# Altium schematic sheet PIC18F16Q20_Curiosity_Nano_Target_MCU.SchDoc
size A3; SheetTitle: Target MCU; CompanyName: Microchip Technology Inc.; Organization: Microchip Technology; Address1: 2355 West Chandler Blvd.; Address2: Chandler, AZ  85224; Address4: USA; SheetNumber: 2; SheetTotal: 4; Time: Time
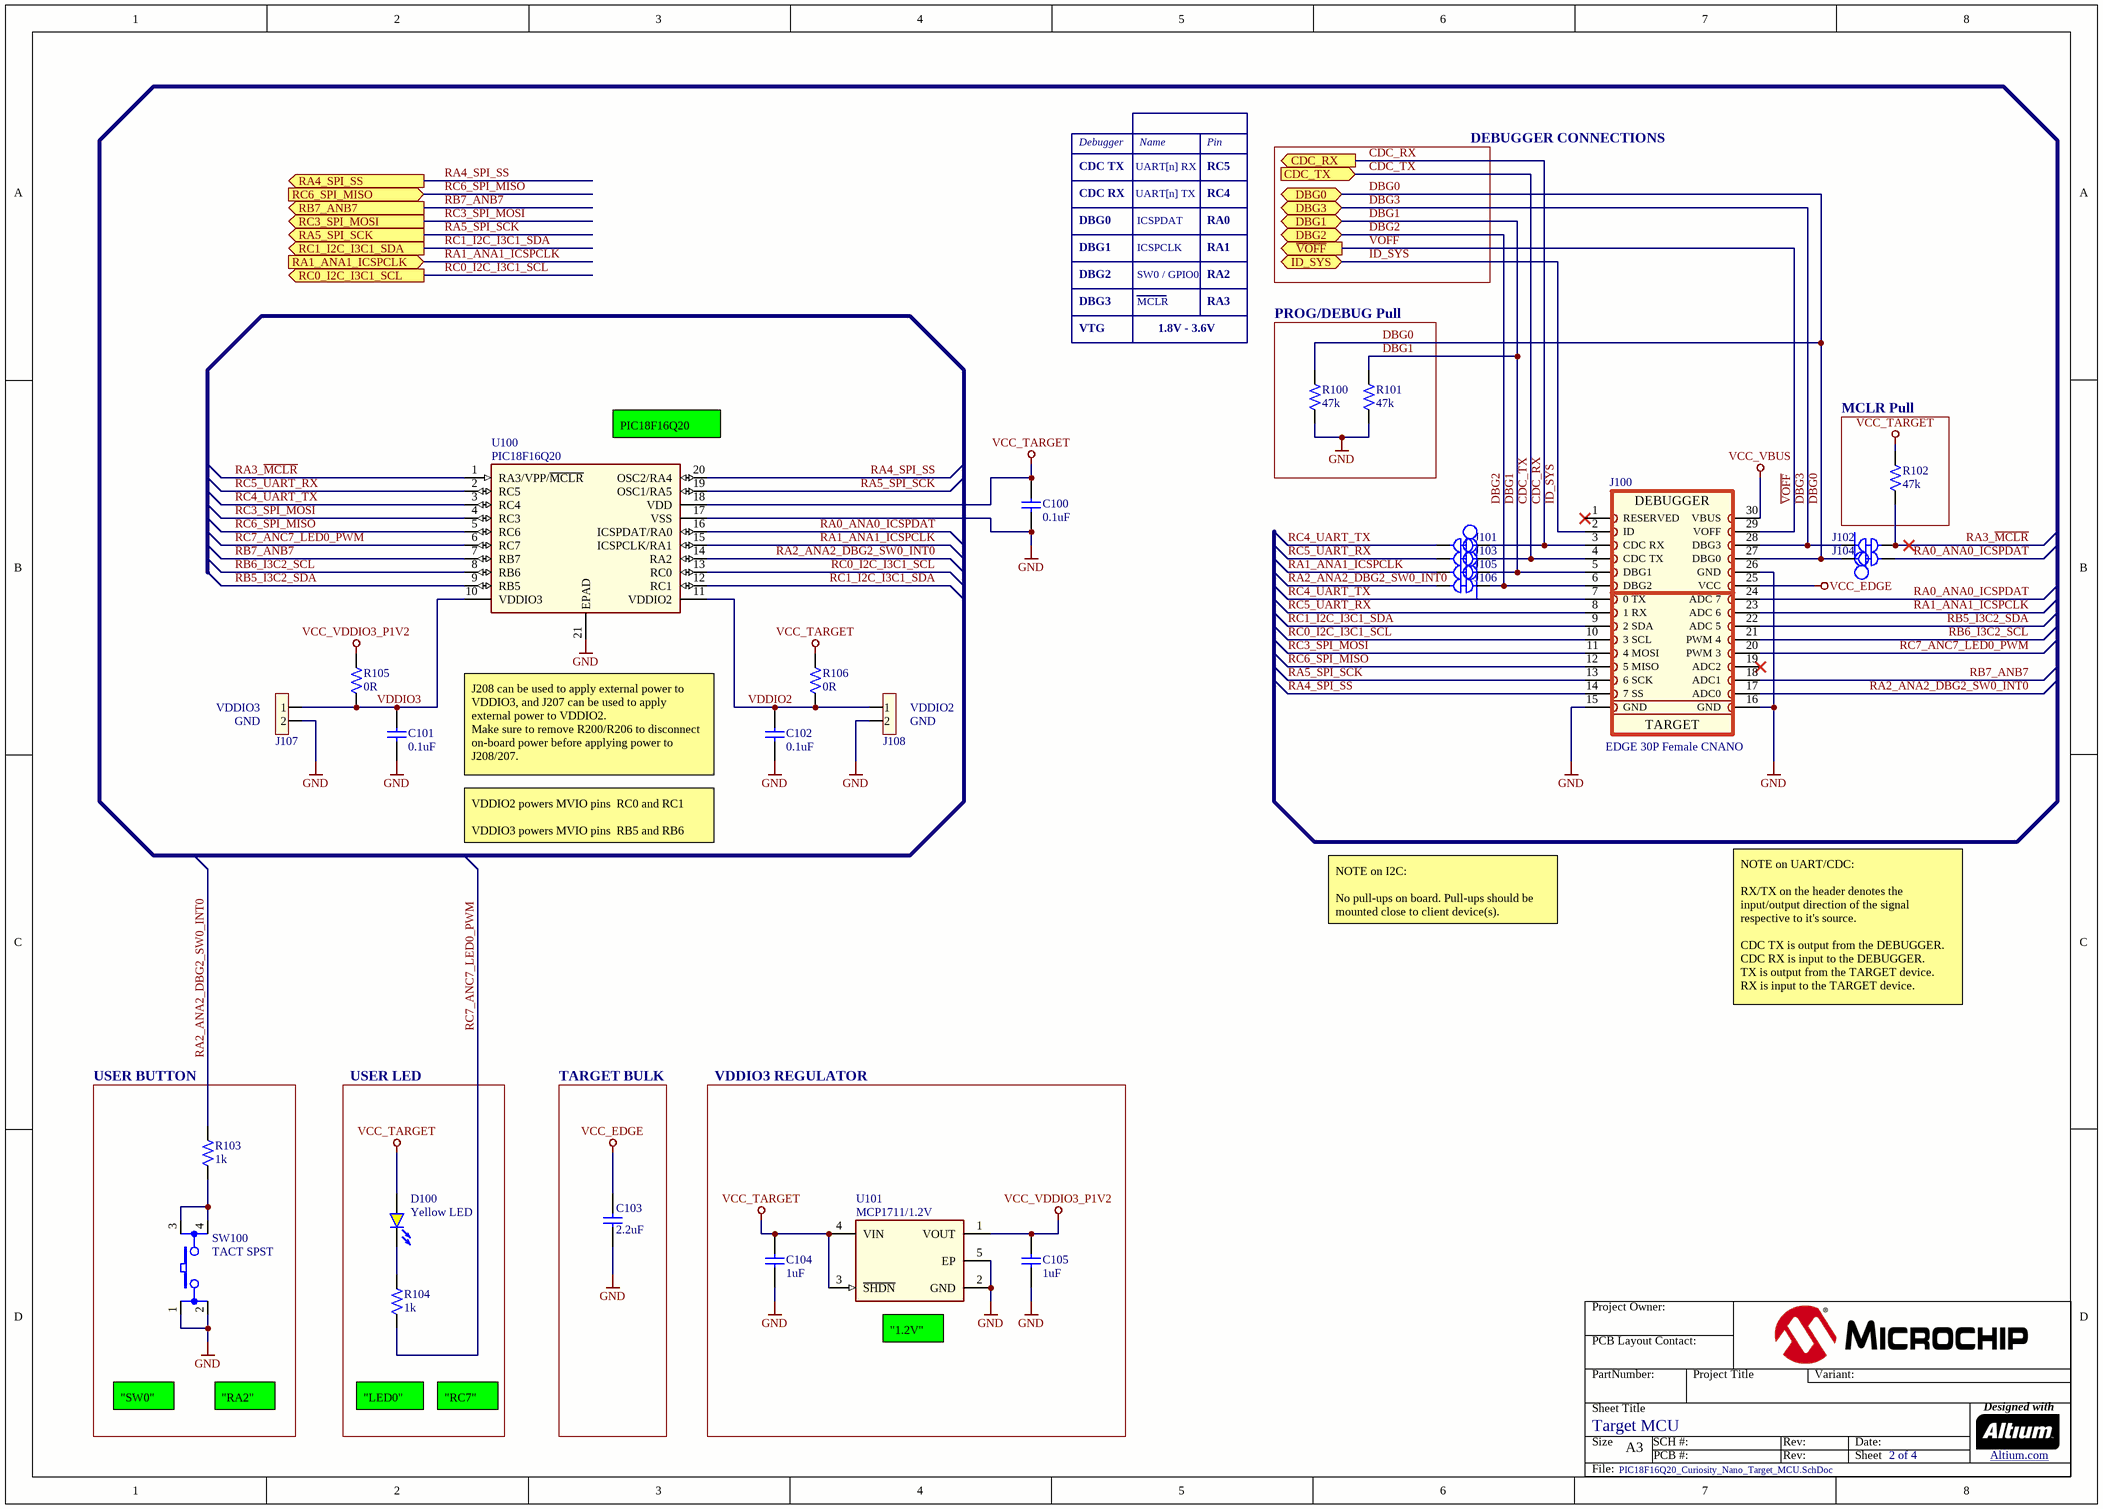
[diagram p0: PIC18F16Q20_Curiosity_Nano_Target_MCU.SchDoc]

## Parts
C100  value 0.1uF  [CAP_C_0402]  (hidden comment: Capacitor NP)
C101  value 0.1uF  [CAP_C_0402]  (hidden comment: Capacitor NP)
C102  value 0.1uF  [CAP_C_0402]  (hidden comment: Capacitor NP)
C103  value 2.2uF  [CAP_C_0402]  (hidden comment: Capacitor NP)
C104  value 1uF  [CAP_C_0402]  (hidden comment: Capacitor NP)
C105  value 1uF  [CAP_C_0402]  (hidden comment: Capacitor NP)
D100  value Yellow LED  [LED_0603_Yellow]  (hidden comment: LED_yellow)
J100  value EDGE 30P Female CNANO  [CON_EDGE_CNANO-30]  (hidden comment: CON EDGE CNANO-30)  (no BOM)
J101  CON JMPR LINK CLOSED  [CON_JMPR_0402_PCB_TRACE_LINK_0.9mm_PAD_0.6mm_PTH]  (value not drawn)  (net tie, no BOM)
J102  CON JMPR LINK CLOSED  [CON_JMPR_0402_PCB_TRACE_LINK_0.9mm_PAD_0.6mm_PTH]  (value not drawn)  (net tie, no BOM)
J103  CON JMPR LINK CLOSED  [CON_JMPR_0402_PCB_TRACE_LINK_0.9mm_PAD_0.6mm_PTH]  (value not drawn)  (net tie, no BOM)
J104  CON JMPR LINK CLOSED  [CON_JMPR_0402_PCB_TRACE_LINK_0.9mm_PAD_0.6mm_PTH]  (value not drawn)  (net tie, no BOM)
J105  CON JMPR LINK CLOSED  [CON_JMPR_0402_PCB_TRACE_LINK_0.9mm_PAD_0.6mm_PTH]  (value not drawn)  (net tie, no BOM)
J106  CON JMPR LINK CLOSED  [CON_JMPR_0402_PCB_TRACE_LINK_0.9mm_PAD_0.6mm_PTH]  (value not drawn)  (net tie, no BOM)
J107  Header 1x2  [HDR_M_2.54_1x2]  (value not drawn)
J108  Header 1x2  [HDR_M_2.54_1x2]  (value not drawn)
R100  value 47k  [RES_C_0402]  (hidden comment: Resistor)
R101  value 47k  [RES_C_0402]  (hidden comment: Resistor)
R102  value 47k  [RES_C_0402]  (hidden comment: Resistor)
R103  value 1k  [RES_C_0402]  (hidden comment: Resistor)
R104  value 1k  [RES_C_0402]  (hidden comment: Resistor)
R105  value 0R  [RES_C_0402]  (hidden comment: Resistor)
R106  value 0R  [RES_C_0402]  (hidden comment: Resistor)
SW100  value TACT SPST  [SW_TACT_SMD_KLS_L-KLS7-TS0304A-2-300-T]  (hidden comment: Switch 4 Pin)
U100  value PIC18F16Q20  [VQFN-20_3X3_EP1.8x1.8]  (hidden comment: PIC18F16Q20 T-I/REB)
U101  value MCP1711/1.2V  [UQFN-4_1x1_EP0.48x0.48]  (hidden comment: MCP1711 UQFN-4)

## Blocks framed on the sheet
PROG/DEBUG Pull: R100 R101
MCLR Pull: R102
USER BUTTON: R103 SW100
USER LED: D100 R104
TARGET BULK: C103
VDDIO3 REGULATOR: C104 C105 U101

## Ports
CDC_RX (out), CDC_TX (in), DBG0 (bidir), DBG1 (bidir), DBG2 (bidir), DBG3 (bidir), ID_SYS (bidir), RA1_ANA1_ICSPCLK (in), RA4_SPI_SS (out), RA5_SPI_SCK (out), RB7_ANB7 (out), RC0_I2C_I3C1_SCL (out), RC1_I2C_I3C1_SDA (out), RC3_SPI_MOSI (out), RC6_SPI_MISO (in), ~{VOFF} (out)

## Nets
GND: C100.2 C101.2 C102.2 C103.1 C104.1 C105.1 J100.15(GND) J100.16(GND) J100.26(GND) J107.2 J108.2 R100.2 R101.2 SW100.1 SW100.2 U100.17(VSS) U100.21(EPAD) U101.2(GND) U101.5(EP)
VCC_EDGE: C103.2 J100.25(VCC)
VCC_TARGET: C100.1 C104.2 D100.1(A) R102.2 R106.2 U100.18(VDD) U101.3(~{SHDN}) U101.4(VIN)
VCC_VBUS: J100.30(VBUS)
VCC_VDDIO3_P1V2: C105.2 R105.2 U101.1(VOUT)
CDC_RX: J100.3(CDC_RX) J101.1 ; port CDC_RX
CDC_TX: J100.4(CDC_TX) J103.1 ; port CDC_TX
DBG0: J100.27(DBG0) J104.1 R100.1 ; port DBG0
DBG1: J100.5(DBG1) J105.1 R101.1 ; port DBG1
DBG2: J100.6(DBG2) J106.1 ; port DBG2
DBG3: J100.28(DBG3) J102.1 ; port DBG3
ID_SYS: J100.2(ID) ; port ID_SYS
RA0_ANA0_ICSPDAT: J100.24(ADC_7) J104.2 U100.16(ICSPDAT/RA0)
RA1_ANA1_ICSPCLK: J100.23(ADC_6) J105.2 U100.15(ICSPCLK/RA1) ; port RA1_ANA1_ICSPCLK
RA2_ANA2_DBG2_SW0_INT0: J100.17(ADC0) J106.2 R103.1 U100.14(RA2)
RA3_~{MCLR}: J102.2 R102.1 U100.1(RA3/VPP/~{MCLR})
RA4_SPI_SS: J100.14(7_SS) U100.20(OSC2/RA4) ; port RA4_SPI_SS
RA5_SPI_SCK: J100.13(6_SCK) U100.19(OSC1/RA5) ; port RA5_SPI_SCK
RB5_I3C2_SDA: J100.22(ADC_5) U100.9(RB5)
RB6_I3C2_SCL: J100.21(PWM_4) U100.8(RB6)
RB7_ANB7: J100.18(ADC1) U100.7(RB7) ; port RB7_ANB7
RC0_I2C_I3C1_SCL: J100.10(3_SCL) U100.13(RC0) ; port RC0_I2C_I3C1_SCL
RC1_I2C_I3C1_SDA: J100.9(2_SDA) U100.12(RC1) ; port RC1_I2C_I3C1_SDA
RC3_SPI_MOSI: J100.11(4_MOSI) U100.4(RC3) ; port RC3_SPI_MOSI
RC4_UART_TX: J100.7(0_TX) J101.2 U100.3(RC4)
RC5_UART_RX: J100.8(1_RX) J103.2 U100.2(RC5)
RC6_SPI_MISO: J100.12(5_MISO) U100.5(RC6) ; port RC6_SPI_MISO
RC7_ANC7_LED0_PWM: J100.20(PWM_3) R104.1 U100.6(RC7)
~{VOFF}: J100.29(VOFF) ; port ~{VOFF}
VDDIO2: C102.1 J108.1 R106.1 U100.11(VDDIO2)
VDDIO3: C101.1 J107.1 R105.1 U100.10(VDDIO3)
NetD100_2: D100.2(K) R104.2
NetR103_2: R103.2 SW100.3 SW100.4

Not connected (* = marked no-connect by the designer): J100 1(RESERVED)* 19(ADC2)*

## Notes on the sheet
- Debugger
- CDC TX
- UART[n] RX
- Name
- RC5
- Pin
- DEBUGGER CONNECTIONS
- DBG0
- CDC RX
- UART[n] TX
- ICSPDAT
- RA0
- RC4
- DBG1
- DBG2
- DBG3
- ICSPCLK
- SW0 / GPIO0
- MCLR
- RA1
- RA2
- RA3
- VTG
- 1.8V - 3.6V
- (near U100) PIC18F16Q20
- (near J107) VDDIO3
- (near J107) GND
- (near J108) GND
- (near J108) VDDIO2
- J208 can be used to apply external power to VDDIO3, and J207 can be used to apply external power to VDDIO2.
  Make sure to remove R200/R206 to disconnect on-board power before applying power to J208/207.
- VDDIO2 powers MVIO pins  RC0 and RC1
  VDDIO3 powers MVIO pins  RB5 and RB6
- NOTE on I2C:
  No pull-ups on board. Pull-ups should be mounted close to client device(s).
- NOTE on UART/CDC:
  RX/TX on the header denotes the input/output direction of the signal respective to it's source.
  CDC TX is output from the DEBUGGER.
  CDC RX is input to the DEBUGGER.
  TX is output from the TARGET device.
  RX is input to the TARGET device.
- (near U101) "1.2V"
- "SW0"
- "RA2"
- "LED0"
- "RC7"
- Project Owner:
- PCB Layout Contact:
- PartNumber:
- Project Title
- Variant:
- Sheet Title
- Size
- A3
- SCH #:
- PCB #:
- Rev:
- Date:
- Sheet
- Designed with
- Altium.com <http://go.altium.com/MicrochipLandingPage_Evaluation.html>
- File:
- (in symbol CON2474) DEBUGGER; TARGET

## Library data of the parts
C100-C102 = CAP1033: Manufacturer 1: Hottech; Manufacturer Part Number 1: C1005B104K160NT; Voltage: 16V; Description_: CAP CER 0.1uF 16V 10% X7R SMD 0402; Tolerance: 10%; Type: Ceramic; Populated: Yes; Temperature Coefficient: X7R; Restricted Sourcing: No; MCHP-ID: CAP1033; Package: 0402; Revision: 10; Symbol: Capacitor NP; Operating Temperature: -55C to +125C; Category: Capacitor; Manufacturer 2: KEMET; Manufacturer Part Number 2: C0402C104K4RAC7867; Supplier 1: Hottech; Supplier Part Number 1: C1005B104K160NT; Supplier 2: Digi-Key; Supplier Part Number 2: 399-C0402C104K4RAC7867TR-ND; Quantity Override: 1; Manufacturer 3: Samsung Electro-Mechanics; Manufacturer Part Number 3: CL05B104KO5NNNC; Supplier 3: Digi-Key; Supplier Part Number 3: 1276-1001-1-ND; Manufacturer 4: Würth Elektronik; Manufacturer Part Number 4: 885012205037; Supplier 4: Digi-Key; Supplier Part Number 4: 732-7532-1-ND; Manufacturer 5: Samsung Electro-Mechanics; Manufacturer 6: Samsung Electro-Mechanics; Manufacturer 7: Yageo; Manufacturer Part Number 5: CL05B104KO5NNND; Manufacturer Part Number 6: CL05B104KO5NNNO; Manufacturer Part Number 7: CC0402KRX7R7BB104; Supplier 5: Mouser; Supplier 6: Samsung Electro-Mechanics; Supplier 7: Yageo; Supplier Part Number 5: 187-CL05B104KO5NNND; Supplier Part Number 6: CL05B104KO5NNNO; Supplier Part Number 7: CC0402KRX7R7BB104
C103 = CAP1208: Manufacturer 1: Hottech; Manufacturer Part Number 1: C1005A225K100NT; Voltage: 10V; Description_: CAP CER 2.2uF 10V 10% X5R SMD 0402; Tolerance: 10%; Type: Ceramic; Populated: YES; Temperature Coefficient: X5R; Restricted Sourcing: No; MCHP-ID: CAP1208; Package: 0402; Revision: 3; Symbol: Capacitor NP; Operating Temperature: -55C to +85C; Category: Capacitor; Supplier 1: Hottech; Supplier Part Number 1: C1005A225K100NT; Quantity Override: 1; Manufacturer 2: Murata; Manufacturer Part Number 2: GRM155R61A225KE95D; Manufacturer 3: Samsung Electro-Mechanics; Manufacturer Part Number 3: CL05A225KP5NSNC; Supplier 2: Murata; Supplier Part Number 2: GRM155R61A225KE95D; Supplier 3: Samsung Electro-Mechanics; Supplier Part Number 3: CL05A225KP5NSNC
C104 C105 = CAP0616: Manufacturer 1: KEMET; Manufacturer Part Number 1: C0402C105K9PACTU; Voltage: 6.3V; Description_: CAP CER 1uF 6.3V 10% X5R SMD 0402; Tolerance: 10%; Temperature Coefficient: X5R; Type: Ceramic; Populated: Yes; Restricted Sourcing: No; MCHP-ID: CAP0616; Package: 0402; Revision: 3; Symbol: Capacitor NP; Operating Temperature: -55C to +85C; Category: Capacitor; Manufacturer 2: Hottech; Manufacturer Part Number 2: C1005A105K6R3NT; Supplier 1: Digi-Key; Supplier Part Number 1: 399-4873-1-ND; Supplier 2: Hottech; Supplier Part Number 2: C1005A105K6R3NT; Quantity Override: 1
D100 = DIODE1547: LED; Manufacturer 1: Rohm Semiconductor; Manufacturer Part Number 1: SML-D12Y1WT86; Description_: LED YELLOW DIFFUSED 1608 SMD; Type: LED Single; Forward Current: 20mA; Populated: YES; Restricted Sourcing: No; MCHP-ID: DIODE1547; Revision: 1; Symbol: LED_yellow; Package: 0603; Category: Diode; Supplier 1: Digi-Key; Supplier Part Number 1: SML-D12Y1WT86CT-ND; Quantity Override: 1
J100 = CON2474: Description_: CON EDGE CURIOSITY-NANO 2.54 30P Female PCB TH; Populated: MECH; Restricted Sourcing: No; MCHP-ID: CON2474; Revision: 1; Symbol: CON EDGE CNANO-30; Type: Edge Card; Category: Connector; Quantity Override: 1; Assembly Type: SMD
J101-J106 = CON2115: Value: CON JMPR LINK CLOSED_0.9mm TH PAD; Description_: CON JUMPER 0402 CLOSED PCB TRACE LINK MANUAL CUT WITH 0.9mm TH PADS; Populated: DNP; Restricted Sourcing: No; MCHP-ID: CON2115; Revision: 1; Symbol: CON JMPR LINK CLOSED; Type: Test Point; Category: Connector; Quantity Override: 1; Assembly Type: Mechanical
J107 J108 = CON1632: Manufacturer 1: Würth Elektronik; Manufacturer Part Number 1: 61300211121; Value: HDR-2.54 Male 1x2; Description_: CON HDR-2.54 Male 1x2 Gold 5.84MH TH VERT; Voltage: 250V; Current: 3A; Populated: YES; MCHP-ID: CON1632; Revision: 3; Symbol: Header 1x2; Type: Header 2.54mm; Category: Connector; Manufacturer 2: SHENZHEN JUNHAO ENGINEERING; Manufacturer Part Number 2: R-211-0211-0021-000; Supplier 1: Digi-Key; Supplier Part Number 1: 732-5315-ND; Supplier 2: SHENZHEN JUNHAO ENGINEERING; Supplier Part Number 2: R-211-0211-0021-000; Quantity Override: 1; Assembly Type: TH; Restricted Sourcing: Yes
R100-R102 = RES2662: Manufacturer 1: Yageo; Manufacturer Part Number 1: RC0402FR-0747KL; Tolerance: 1%; Description_: RES TKF 47k 1% 1/16W SMD 0402; Voltage: 50V; Populated: YES; Restricted Sourcing: No; MCHP-ID: RES2662; Package: 0402; Revision: 2; Symbol: Resistor; Category: Resistor; Type: RES SMD; Composition: TKF; Supplier 1: Digi-Key; Supplier Part Number 1: 311-47.0KLRCT-ND; Quantity Override: 1; Manufacturer 2: Hottech; Manufacturer Part Number 2: RI0402L4702FT; Supplier 2: Hottech; Supplier Part Number 2: RI0402L4702FT
R103 R104 = RES1022: Manufacturer 1: Panasonic; Manufacturer Part Number 1: ERJ-2RKF1001X; Tolerance: 1%; Description_: RES TKF 1k 1% 1/10W SMD 0402; Voltage: 50V; Power: 1/10W; Populated: YES; Temperature Coefficient: 100ppm/C; MCHP-ID: RES1022; Package: 0402; Revision: 3; Symbol: Resistor; Operating Temperature: -55C to +155C; Category: Resistor; Type: RES SMD; Composition: TKF; Supplier 1: Digi-Key; Supplier Part Number 1: P1.00KLTR-ND; Quantity Override: 1
R105 R106 = RSMT1040: Manufacturer 1: Yageo; Manufacturer Part Number 1: RC0402JR-070RL; Description_: RES TKF 0R 1/16W SMD 0402; Power: 1/16W; Populated: Yes; MCHP-ID: RSMT1040; Package: 0402; Revision: 3; Symbol: Resistor; Operating Temperature: -55C to +155C; Category: Resistor; Type: RES SMD; Composition: TKF; Supplier 1: Digi-Key; Supplier Part Number 1: 311-0.0JRCT-ND; Quantity Override: 1; Manufacturer 2: Stackpole Electronics Inc; Manufacturer Part Number 2: RMCF0402ZT0R00; Supplier 2: Digi-Key; Supplier Part Number 2: RMCF0402ZT0R00TR-ND
SW100 = SWITCH1170: Switch; Manufacturer 1: KLS Electronic; Manufacturer Part Number 1: L-KLS7-TS0304A-2-300-T; Description_: SWITCH TACT SPST 12V 50mA L-KLS7-TS0304A-2-300-T SMD; Voltage: 12V; Current: 50mA; Populated: YES; Restricted Sourcing: No; MCHP-ID: SWITCH1170; Revision: 1; Symbol: Switch 4 Pin; Category: Switch; Supplier 1: Cabcon A/S; Supplier Part Number 1: L-KLS7-TS0304A-2-300-T; Quantity Override: 1; Type: Tactile
U100 = MIC9477: Manufacturer 1: Microchip Technology; Description_: MCHP MCU 8-BIT 64MHz 64KB 4KB PIC18F16Q20T-I/REB VQFN-20; Populated: YES; Restricted Sourcing: No; MCHP-ID: MIC9477; Symbol: PIC18F16Q20 VQFN-20; Type: 8-Bit; Revision: 2; Category: MCHP-Microcontroller; Manufacturer Part Number 1: PIC18F16Q20T-I/REB; Supplier 1: Microchip Technology; Supplier Part Number 1: PIC18F16Q20T-I/REB; Operating Temperature: -40°C to +85°C; Quantity Override: 1; Manufacturer 2: Microchip Technology; Manufacturer Part Number 2: PIC18F16Q20-I/REB; Supplier 2: Microchip Technology; Supplier Part Number 2: PIC18F16Q20-I/REB
U101 = MIC9478: LDO MCP1711; Manufacturer 1: Microchip Technology; Manufacturer Part Number 1: MCP1711T-12I/5X; Description_: MCHP ANALOG LDO 1.2V MCP1711T-12I/5X UQFN-4; Populated: YES; Restricted Sourcing: No; MCHP-ID: MIC9478; Symbol: MCP1711 UQFN-4; Type: LDO; Revision: 1; Category: MCHP-Analog; Supplier 1: Microchip Technology; Supplier Part Number 1: MCP1711T-12I/5X; Operating Temperature: -40°C to +85°C; Quantity Override: 1